# Altium schematic sheet PCB-PWR_03_3V3_DIGITAL.SchDoc
size 420 x 297 mm
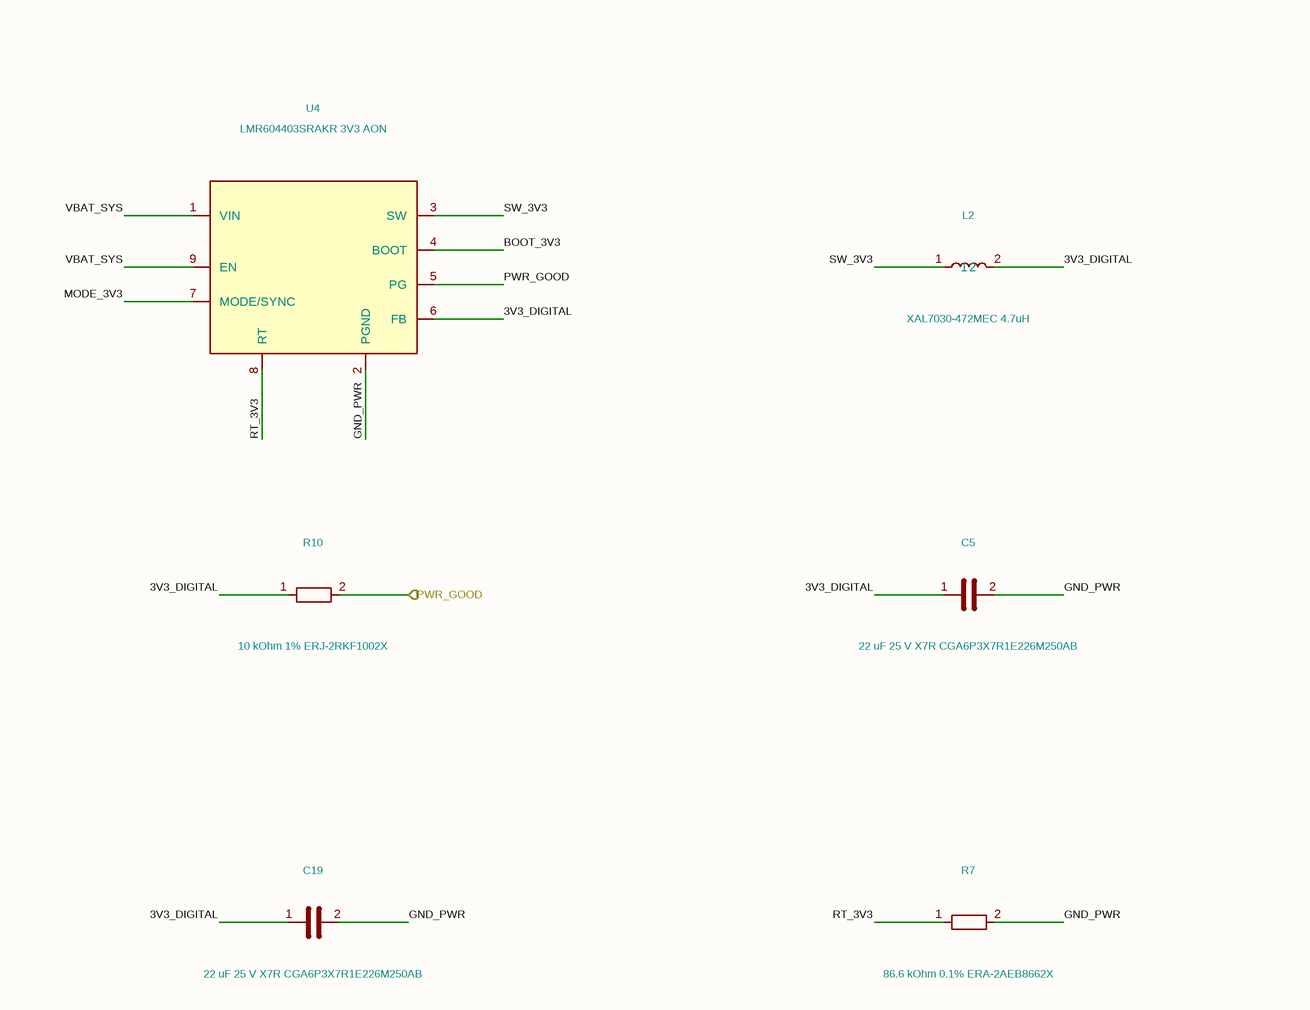
[diagram p0: PCB-PWR_03_3V3_DIGITAL.SchDoc, top left]
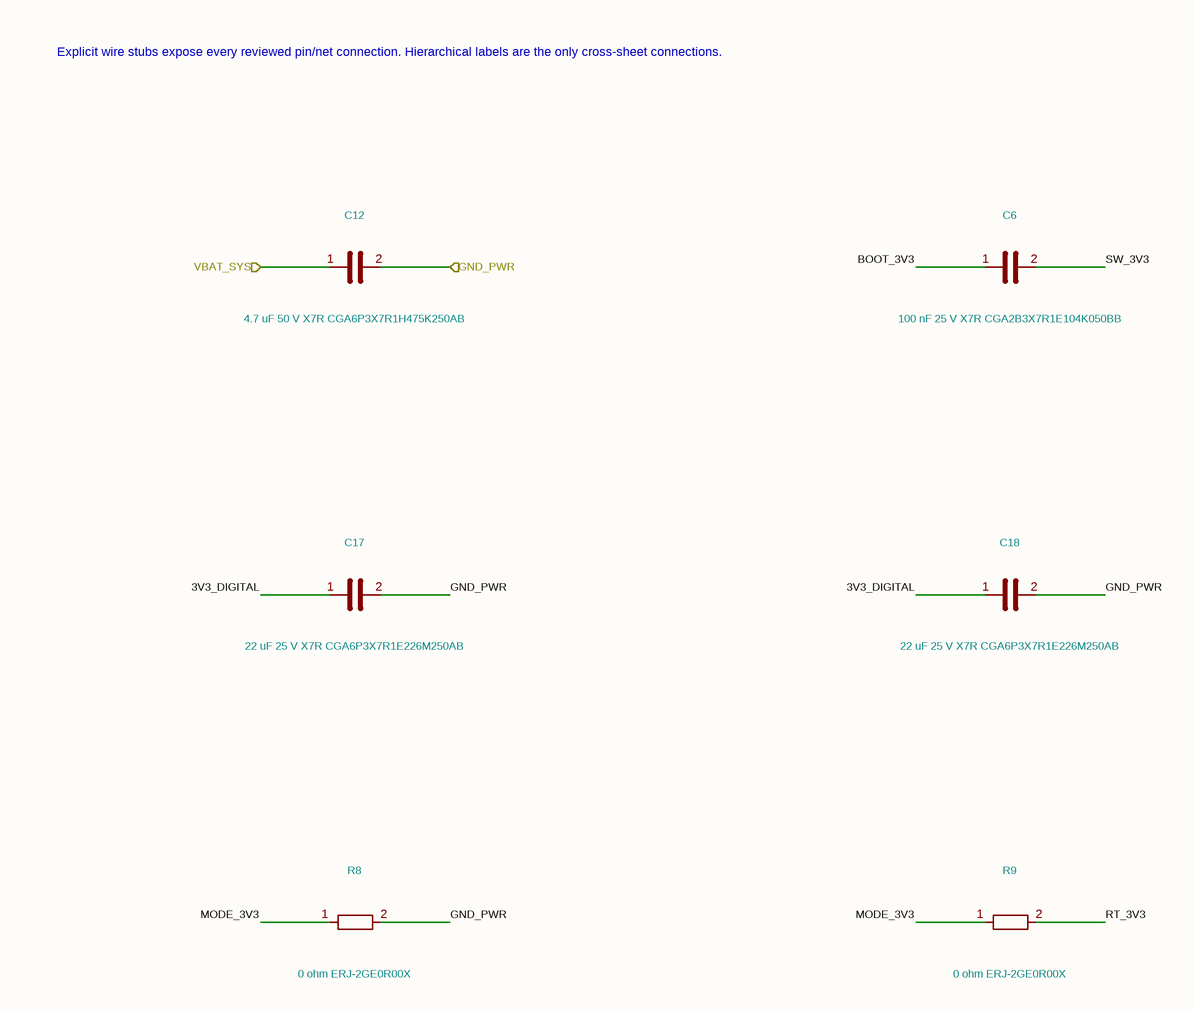
[diagram p1: PCB-PWR_03_3V3_DIGITAL.SchDoc, top right]
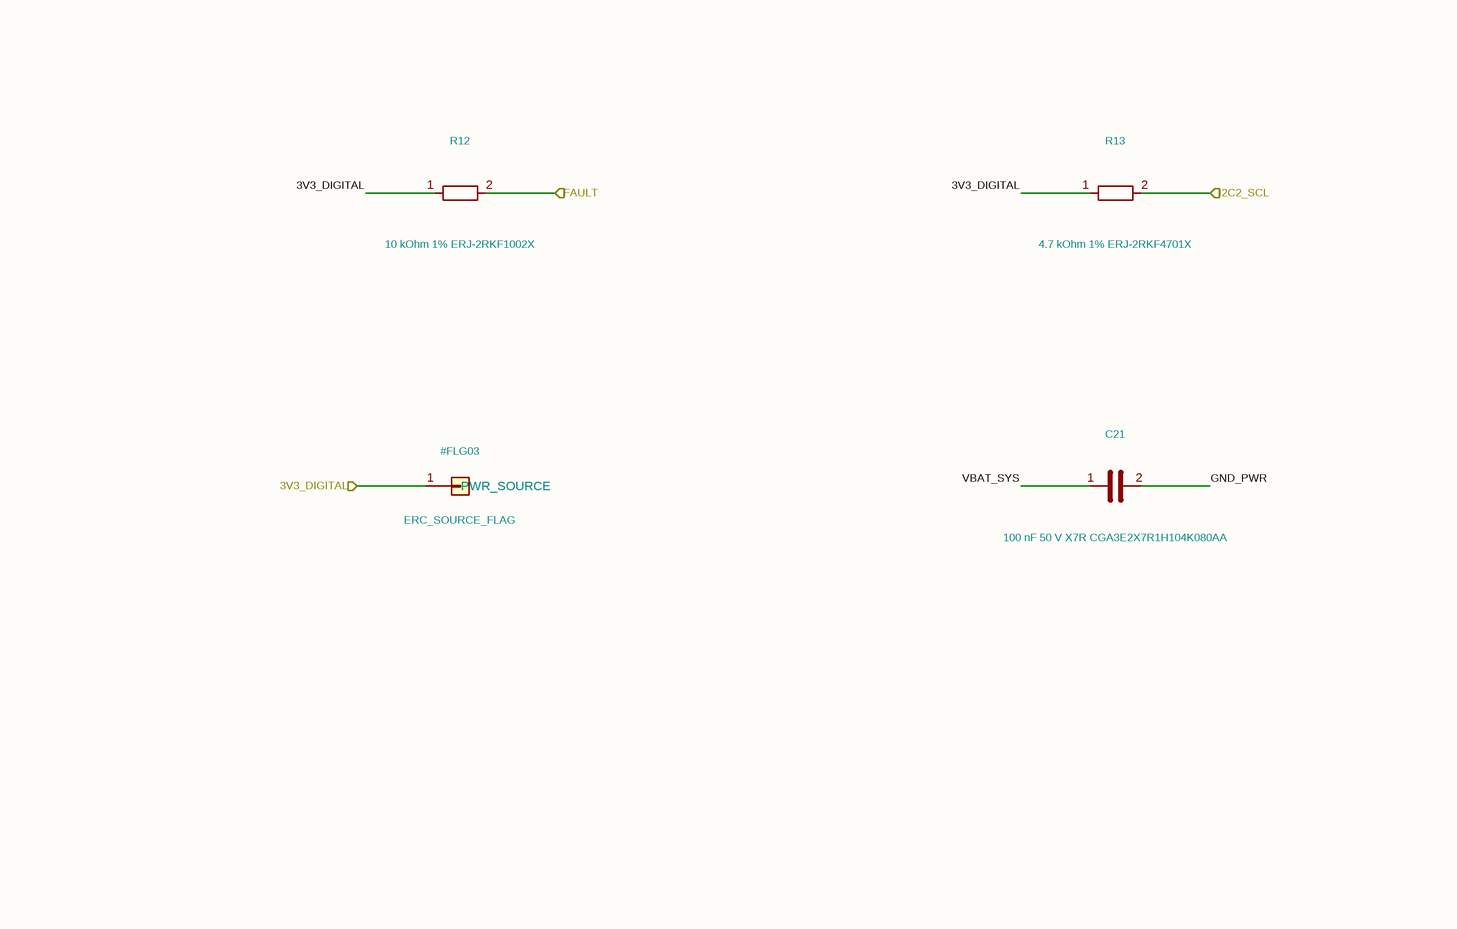
[diagram p2: PCB-PWR_03_3V3_DIGITAL.SchDoc, bottom left]
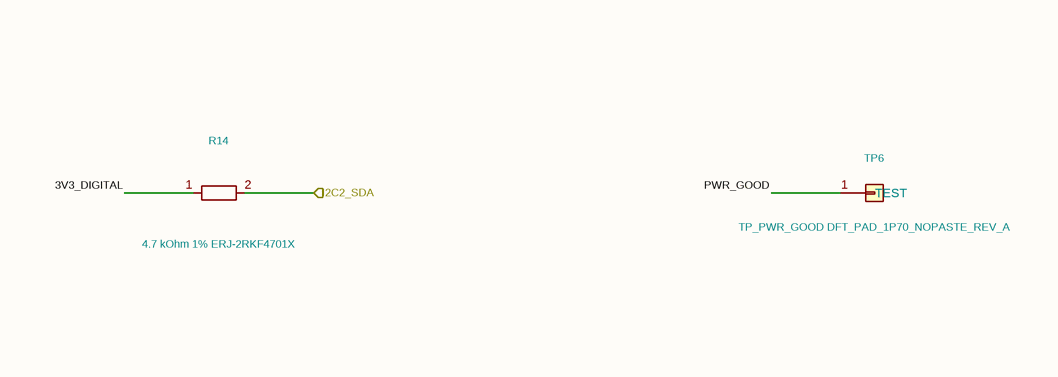
[diagram p3: PCB-PWR_03_3V3_DIGITAL.SchDoc, bottom right]

## Parts
#FLG03  ERC_SOURCE_FLAG
C5  22 uF 25 V X7R CGA6P3X7R1E226M250AB  [C_1210_3225Metric]
C6  100 nF 25 V X7R CGA2B3X7R1E104K050BB  [C_0402_1005Metric]
C12  4.7 uF 50 V X7R CGA6P3X7R1H475K250AB  [C_1210_3225Metric]
C17  22 uF 25 V X7R CGA6P3X7R1E226M250AB  [C_1210_3225Metric]
C18  22 uF 25 V X7R CGA6P3X7R1E226M250AB  [C_1210_3225Metric]
C19  22 uF 25 V X7R CGA6P3X7R1E226M250AB  [C_1210_3225Metric]
C21  100 nF 50 V X7R CGA3E2X7R1H104K080AA  [C_0603_1608Metric]
L2  XAL7030-472MEC 4.7uH  [Coilcraft_XAL7030_472]
R7  86.6 kOhm 0.1% ERA-2AEB8662X  [R_0402_1005Metric]
R8  0 ohm ERJ-2GE0R00X  [R_0402_1005Metric]
R9  0 ohm ERJ-2GE0R00X  [R_0402_1005Metric]
R10  10 kOhm 1% ERJ-2RKF1002X  [R_0402_1005Metric]
R12  10 kOhm 1% ERJ-2RKF1002X  [R_0402_1005Metric]
R13  4.7 kOhm 1% ERJ-2RKF4701X  [R_0402_1005Metric]
R14  4.7 kOhm 1% ERJ-2RKF4701X  [R_0402_1005Metric]
TP6  TP_PWR_GOOD DFT_PAD_1P70_NOPASTE_REV_A  [TestPoint_DFT_1.7mm_NoPaste]
U4  LMR604403SRAKR 3V3 AON  [LMR60440_RAK0009A]

## Ports
3V3_DIGITAL, FAULT, GND_PWR, I2C2_SCL, I2C2_SDA, PWR_GOOD, VBAT_SYS

## Nets
3V3_DIGITAL: #FLG03.1(PWR_SOURCE) ; port 3V3_DIGITAL
3V3_DIGITAL: C5.1 C17.1 C18.1 C19.1 L2.2 R10.1 R12.1 R13.1 R14.1 U4.6(FB)  [a separate net that carries the same name]
BOOT_3V3: C6.1 U4.4(BOOT)
FAULT: R12.2 ; port FAULT
GND_PWR: C12.2 ; port GND_PWR
GND_PWR: C5.2 C17.2 C18.2 C19.2 C21.2 R7.2 R8.2 U4.2(PGND)  [a separate net that carries the same name]
I2C2_SCL: R13.2 ; port I2C2_SCL
I2C2_SDA: R14.2 ; port I2C2_SDA
MODE_3V3: R8.1 R9.1 U4.7(MODE/SYNC)
PWR_GOOD: R10.2 ; port PWR_GOOD
PWR_GOOD: TP6.1(TEST) U4.5(PG)  [a separate net that carries the same name]
RT_3V3: R7.1 R9.2 U4.8(RT)
SW_3V3: C6.2 L2.1 U4.3(SW)
VBAT_SYS: C12.1 ; port VBAT_SYS
VBAT_SYS: C21.1 U4.1(VIN) U4.9(EN)  [a separate net that carries the same name]

## Notes on the sheet
- Explicit wire stubs expose every reviewed pin/net connection. Hierarchical labels are the only cross-sheet connections.
- 1
- 2
- 3
- 4
- 5
- 6
- 7
- 8
- A
- B
- C
- D
- E
- Human-readable hierarchy; exact pin/net equivalence enforced
- Functional sheet 4 of 5
- NOT FOR MANUFACTURE - routing/DRC/DFM/Review B pending
- Title: 3V3 AON rail
- File: PCB-PWR_03_3V3_DIGITAL.kicad_sch
- Sheet: /
- Dioneya / ZS-BPLA
- F
- KiCad E.D.A.  kicad (5.1.4)-1
- Size: A3
- Date: 2026-09-17
- Rev: A
- Id: 1/1

## Library data of the parts
C5 C6 C12 C17-C19 C21 = C
  C5 C17-C19: Value: 22 uF 25 V X7R CGA6P3X7R1E226M250AB; Footprint: Capacitor_SMD:C_1210_3225Metric
  C6: Value: 100 nF 25 V X7R CGA2B3X7R1E104K050BB; Footprint: Capacitor_SMD:C_0402_1005Metric
  C12: Value: 4.7 uF 50 V X7R CGA6P3X7R1H475K250AB; Footprint: Capacitor_SMD:C_1210_3225Metric
  C21: Value: 100 nF 50 V X7R CGA3E2X7R1H104K080AA; Footprint: Capacitor_SMD:C_0603_1608Metric
L2 = L: Value: XAL7030-472MEC 4.7uH; Footprint: DioneyaPWR:Coilcraft_XAL7030_472
R7-R10 R12-R14 = R: Footprint: Resistor_SMD:R_0402_1005Metric
  R7: Value: 86.6 kOhm 0.1% ERA-2AEB8662X
  R8 R9: Value: 0 ohm ERJ-2GE0R00X
  R10 R12: Value: 10 kOhm 1% ERJ-2RKF1002X
  R13 R14: Value: 4.7 kOhm 1% ERJ-2RKF4701X
TP6 = TESTPOINT: Value: TP_PWR_GOOD DFT_PAD_1P70_NOPASTE_REV_A; Footprint: DioneyaPWR:TestPoint_DFT_1.7mm_NoPaste
U4 = Conn_01x09: Value: LMR604403SRAKR 3V3 AON; Footprint: DioneyaPWR:LMR60440_RAK0009A
#FLG03 = ERC_SOURCE_FLAG: Value: ERC_SOURCE_FLAG